# EasyEDA Pro project 辅助电源.epro, schematic 3V3/5V
Board Name: 辅助电源(BUCK); Create Date: 2024-06-08; Page Name: P1; Project Name: 开关电源实验平台; Schematic Name: 3V3/5V; Update Date: 2024-12-12; Company: 嘉立创EDA; Page Size: A4; Version: V1.0
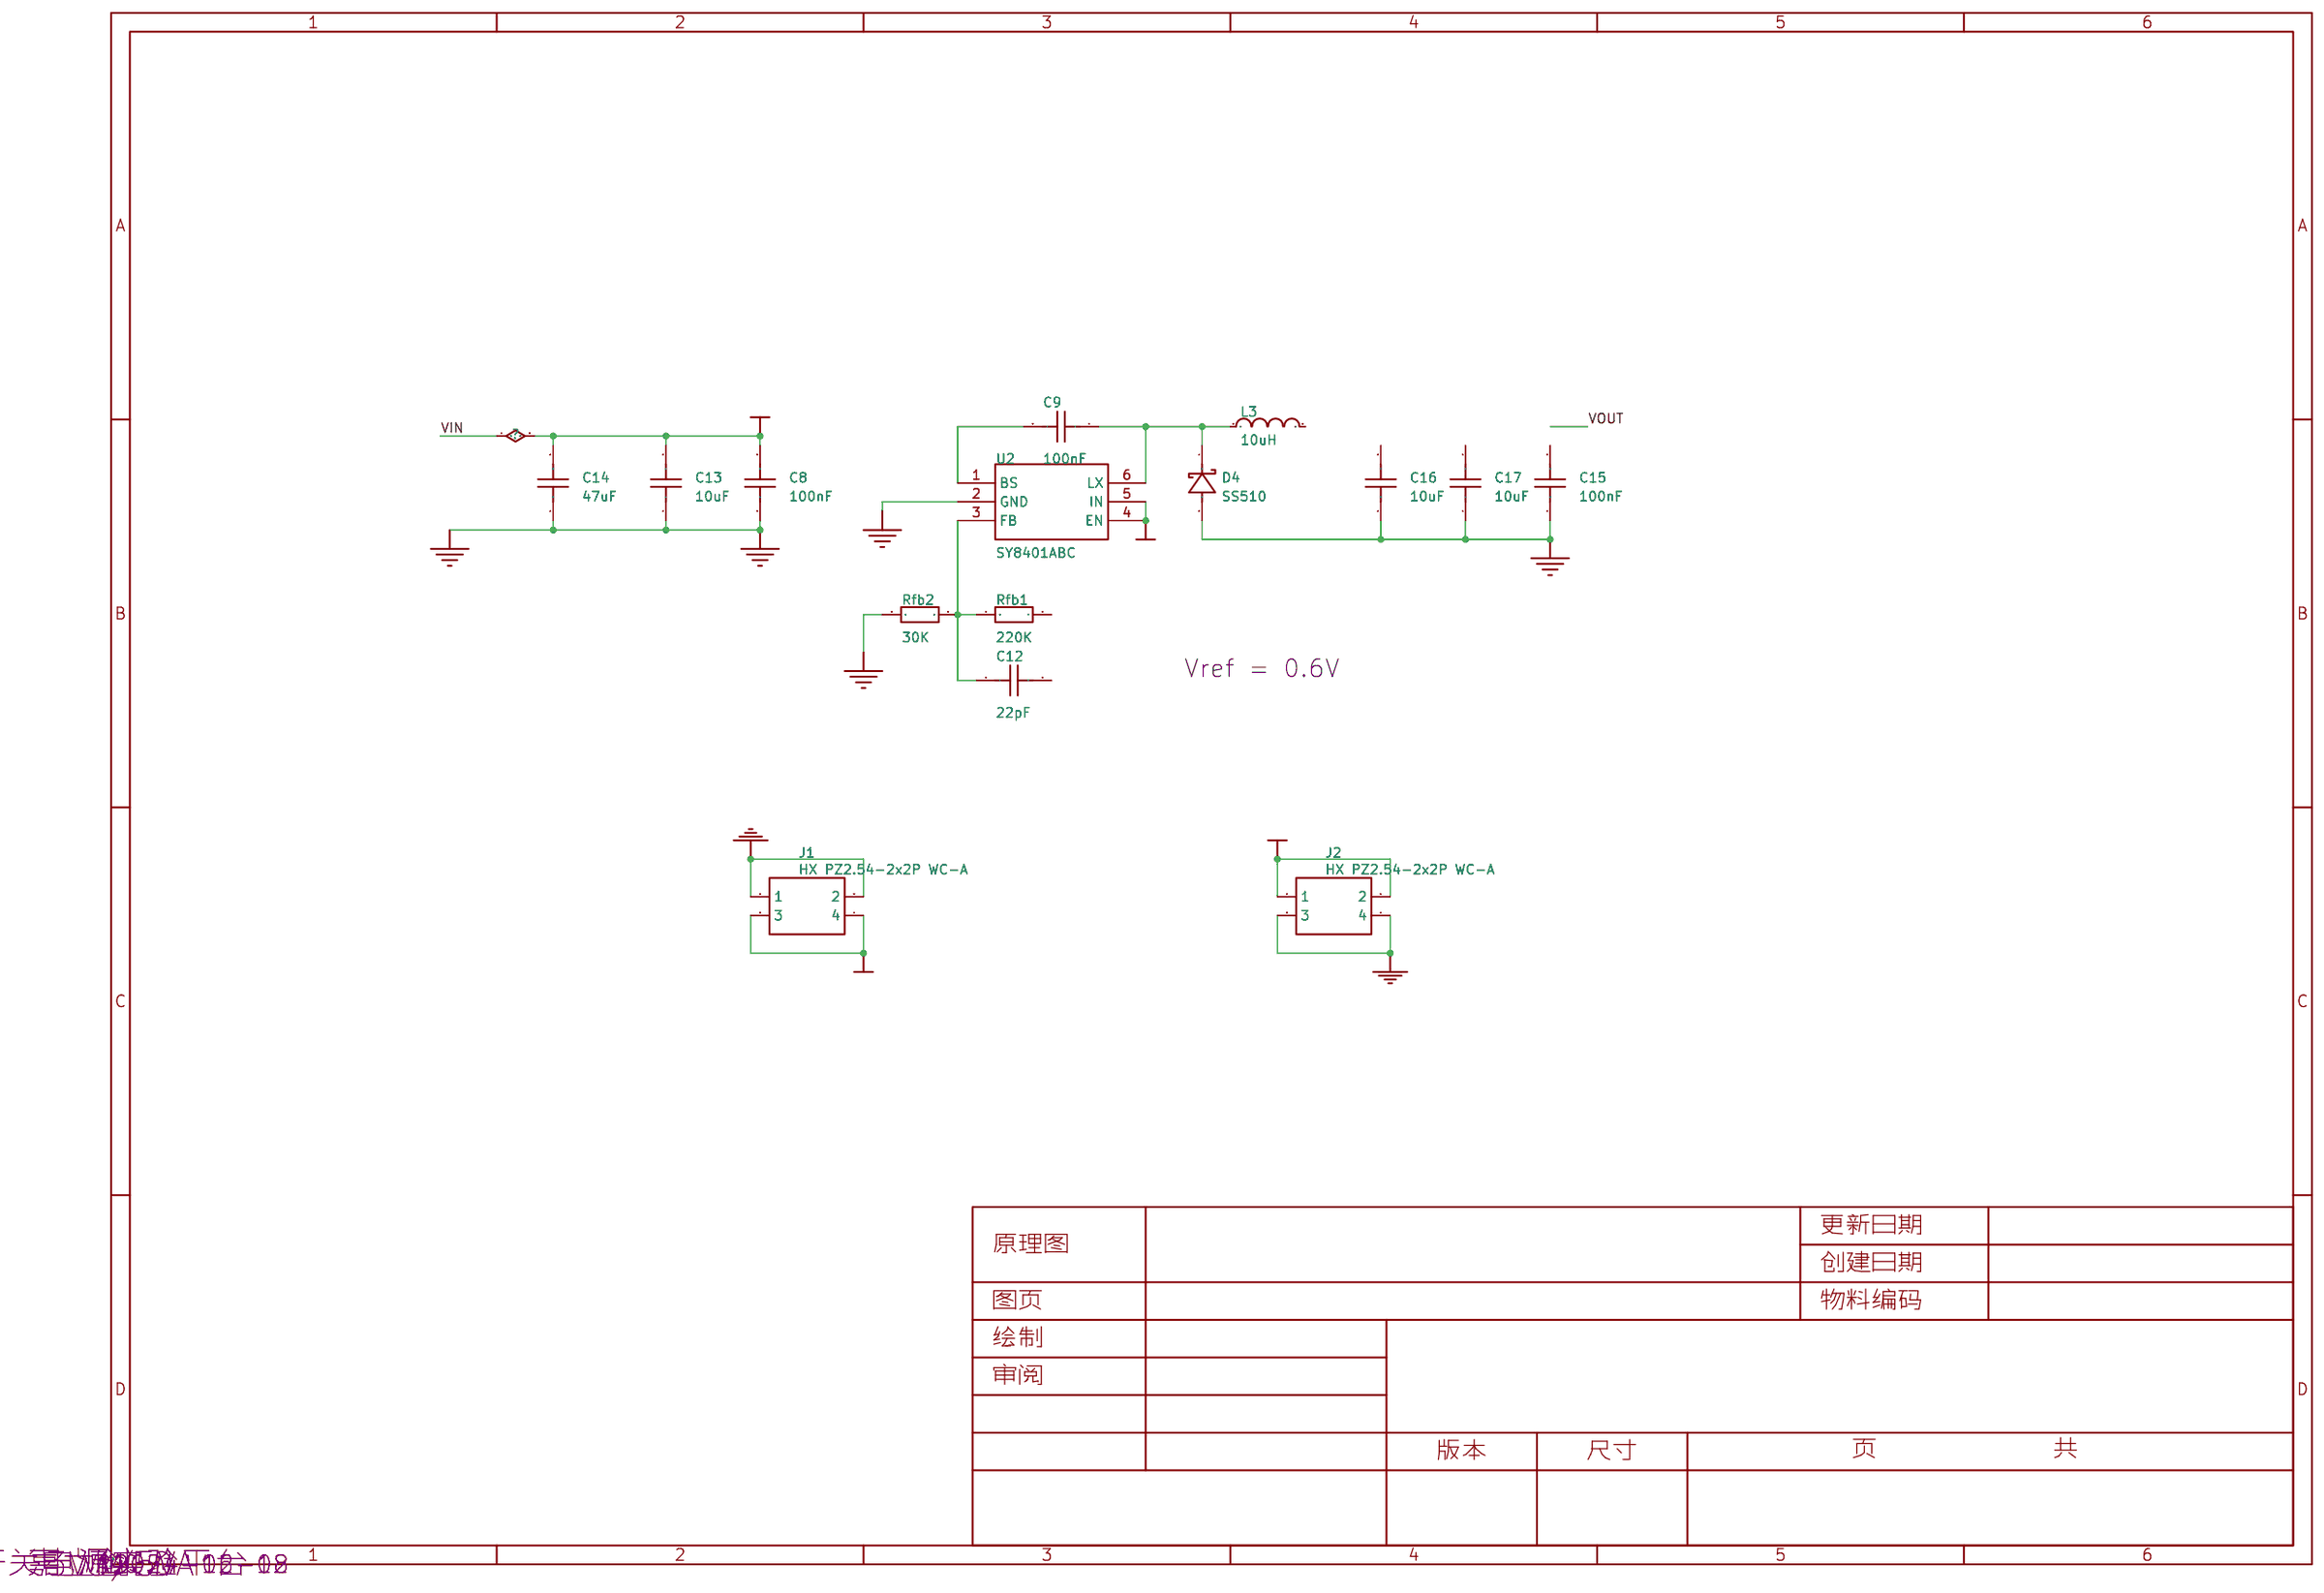
[diagram p2: schematic sheet]

## Parts
C8  100nF  [C1206]
C9  100nF  [C0805]
C12  22pF  [C0603]
C13  10uF  [C1206]
C14  47uF  [C1206]
C15  100nF  [C1206]
C16  10uF  [C1206]
C17  10uF  [C1206]
D4  SS510  [SMA_L4.3-W2.6-LS5.0-RD]
J1  HX PZ2.54-2x2P WC-A  [HDR-TH_4P-P2.54-H-M-R2-C2-S2.54-W10.0]
J2  HX PZ2.54-2x2P WC-A  [HDR-TH_4P-P2.54-H-M-R2-C2-S2.54-W10.0]
L3  10uH  [IND-SMD_L7.3-W6.8]
Rfb1  220K  [R0805]
Rfb2  30K  [R0805]
U2  SY8401ABC  [SOT-23-6_L2.9-W1.6-P0.95-LS2.8-BR]

## Library data of the parts
C8 C9 C13-C17 = CAP_0805: Supplier Footprint: 0805
C12 = CAP_0603: Supplier Footprint: 0603
D4 = SS510_C727067: 二极管配置:独立式;直流反向耐压(Vr):100V;平均整流电流(Io):5A;正向压降(Vf):850mV@5A;; LCSC Part Name: 电压:100V 电流:5A; Supplier Part: C727067; Manufacturer: TWGMC(台湾迪嘉); Supplier Footprint: SMA(DO-214AC); JLCPCB Part Class: Extended Part; Datasheet: https://atta.szlcsc.com/upload/public/pdf/source/20200828/C727064_BD0A2B36CBC76CEA4B6710C57718D41F.pdf; Supplier: LCSC; Diode Configuration: 独立式; Reverse Voltage (Vr): 100V; Average Rectified Current (Io): 5A; Forward Voltage (Vf@If): 850mV@5A; Reverse Leakage Current (Ir): 500uA@100V
J1 J2 = HX PZ2.54-2x2P WC-A: 插针结构:2x2P;间距:2.54mm;行距:2.54mm;圆针/方针:方针;安装方式:弯插;排数:双排;总PIN位数:4P;额定电流:3A;额定电压:1kV;配合针长度:6mm;塑高:2.5mm;端接针长度:3mm;触头材质:黄铜;触头镀层:金;工作温度:-40℃~+105℃;颜色:黑色;; LCSC Part Name: 2x2P 间距:2.54mm 方针 弯插; Supplier Part: C41417350; Manufacturer: hanxia(韩下); Supplier Footprint: 弯插,P=2.54mm; JLCPCB Part Class: 扩展库; Datasheet: https://item.szlcsc.com/datasheet/HX%2520PZ2.54-2x2P%2520WC-A/43243354.html; Supplier: LCSC; Pin Structure: 2x2P; Pitch: 2.54mm; Row Spacing: 2.54mm; Circluar Pins/Square Pins: 方针; Mounting Type: 弯插; Number of Rows: 双排; Number of Pins: 4P; Current Rating: 3A; Voltage Rating (Max): 1kV; Length of Mating Pin: 6mm; Insulation Height: 2.5mm; Length of End Connection Pin: 3mm; Contact Material: 黄铜; Contact Plating: 金; Operating Temperature: -40℃~+105℃; Color: 黑色
L3 = FXL0630-100-M: 电感值:10uH;精度:±20%;额定电流:4.5A;饱和电流(Isat):5.5A;类型:一体成型电感;; LCSC Part Name: 10uH ±20% 5.5A; Supplier Part: C167223; Manufacturer: cjiang(长江微电); Supplier Footprint: SMD,6.6x7mm; JLCPCB Part Class: Extended Part; Datasheet: https://atta.szlcsc.com/upload/public/pdf/source/20230516/3A080F5AF8C87BB81C3BA86E5F60E51A.pdf; Supplier: LCSC; Tolerance: ±20%; Rated Current: 4.5A; Saturation Current (Isat): 5.5A; DC Resistance (DCR): 68mΩ; Type: 一体成型电感
Rfb1 Rfb2 = Res_0805: Supplier Footprint: 0805
U2 = SY8401ABC: 功能类型:降压型;输入电压:-;输出电流(最大值):-;; Supplier Part: C125906; Manufacturer: silergy(矽力杰); Supplier Footprint: SOT-23-6; JLCPCB Part Class: 扩展库; Datasheet: https://atta.szlcsc.com/upload/public/pdf/source/20171014/C125906_15079752809031037944.pdf; Supplier: LCSC; Function: 降压型; Switch tube (built-in/external): 内置

## Nets
GND: C8.1 C13.1 C14.1 C15.1 C16.1 C17.1 D4.2(A) J1.1 J1.2 J2.3 J2.4 Rfb2.1 U2.2(GND)
VIN: C8.2 C13.2 C14.2 J1.3 J1.4 U2.4(EN) U2.5(IN)
VOUT: C12.2 C15.2 C16.2 C17.2 J2.1 J2.2 L3.2 Rfb1.2
$1N562: C12.1 Rfb1.1 Rfb2.2 U2.3(FB)
$1N567: C9.2 U2.1(BS)
$1N1221: C9.1 D4.1(K) L3.1 U2.6(LX)

## Notes on the sheet
- Vref = 0.6V
